# Altium schematic sheet Sheet3.SchDoc
size A4; SheetNumber: 3; SheetTotal: 3
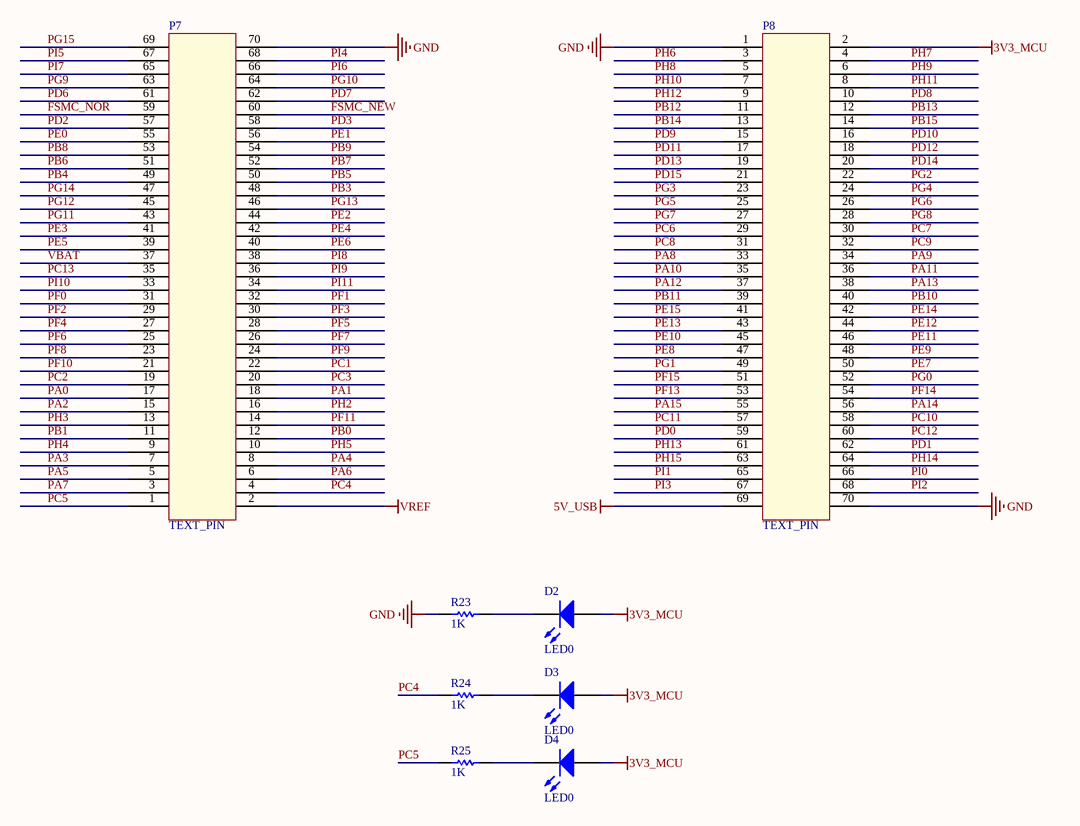
[diagram p0: Sheet3.SchDoc]

## Parts
D2  LED0  [LED0603-RD_RED]
D3  LED0  [LED0603-RD_RED]
D4  LED0  [LED0603-RD_RED]
P7  TEXT_PIN  [TEST_P70]
P8  TEXT_PIN  [TEST_P70]
R23  1K  [R0603]
R24  1K  [R0603]
R25  1K  [R0603]

## Nets
3V3_MCU: D2.1(A) D3.1(A) D4.1(A) P8.2
5V_USB: P8.69
GND: P7.70 P8.1 P8.70 R23.2
VREF: P7.2
FSMC_NEW: P7.60
FSMC_NOR: P7.59
PA0: P7.17
PA1: P7.18
PA2: P7.15
PA3: P7.7
PA4: P7.8
PA5: P7.5
PA6: P7.6
PA7: P7.3
PA8: P8.33
PA9: P8.34
PA10: P8.35
PA11: P8.36
PA12: P8.37
PA13: P8.38
PA14: P8.56
PA15: P8.55
PB0: P7.12
PB1: P7.11
PB3: P7.48
PB4: P7.49
PB5: P7.50
PB6: P7.51
PB7: P7.52
PB8: P7.53
PB9: P7.54
PB10: P8.40
PB11: P8.39
PB12: P8.11
PB13: P8.12
PB14: P8.13
PB15: P8.14
PC1: P7.22
PC2: P7.19
PC3: P7.20
PC4: P7.4 R24.2
PC5: P7.1 R25.2
PC6: P8.29
PC7: P8.30
PC8: P8.31
PC9: P8.32
PC10: P8.58
PC11: P8.57
PC12: P8.60
PC13: P7.35
PD0: P8.59
PD1: P8.62
PD2: P7.57
PD3: P7.58
PD6: P7.61
PD7: P7.62
PD8: P8.10
PD9: P8.15
PD10: P8.16
PD11: P8.17
PD12: P8.18
PD13: P8.19
PD14: P8.20
PD15: P8.21
PE0: P7.55
PE1: P7.56
PE2: P7.44
PE3: P7.41
PE4: P7.42
PE5: P7.39
PE6: P7.40
PE7: P8.50
PE8: P8.47
PE9: P8.48
PE10: P8.45
PE11: P8.46
PE12: P8.44
PE13: P8.43
PE14: P8.42
PE15: P8.41
PF0: P7.31
PF1: P7.32
PF2: P7.29
PF3: P7.30
PF4: P7.27
PF5: P7.28
PF6: P7.25
PF7: P7.26
PF8: P7.23
PF9: P7.24
PF10: P7.21
PF11: P7.14
PF13: P8.53
PF14: P8.54
PF15: P8.51
PG0: P8.52
PG1: P8.49
PG2: P8.22
PG3: P8.23
PG4: P8.24
PG5: P8.25
PG6: P8.26
PG7: P8.27
PG8: P8.28
PG9: P7.63
PG10: P7.64
PG11: P7.43
PG12: P7.45
PG13: P7.46
PG14: P7.47
PG15: P7.69
PH2: P7.16
PH3: P7.13
PH4: P7.9
PH5: P7.10
PH6: P8.3
PH7: P8.4
PH8: P8.5
PH9: P8.6
PH10: P8.7
PH11: P8.8
PH12: P8.9
PH13: P8.61
PH14: P8.64
PH15: P8.63
PI0: P8.66
PI1: P8.65
PI2: P8.68
PI3: P8.67
PI4: P7.68
PI5: P7.67
PI6: P7.66
PI7: P7.65
PI8: P7.38
PI9: P7.36
PI10: P7.33
PI11: P7.34
VBAT: P7.37
NetD2_2: D2.2(K) R23.1
NetD3_2: D3.2(K) R24.1
NetD4_2: D4.2(K) R25.1

## Library data of the parts
D2-D4 = LED0: Typical INFRARED GaAs LED; Published: 8-Jun-2000; LatestRevisionDate: 08-Jul-2005; LatestRevisionNote: Mech Layer 1 removed.; PackageReference: LED-0; Publisher: Altium Limited; PackageDescription: LED; 2 Leads
R23-R25 = Res1: Resistor; Published: 8-Jun-2000; LatestRevisionDate: 17-Jul-2002; LatestRevisionNote: Re-released for DXP Platform.; PackageReference: AXIAL-0.3; Publisher: Altium Limited; PackageDescription: Axial Device, Thru-Hole; 2 Leads; 0.3 in Pin Spacing; Value: 1K